# Altium schematic sheet Sheet4.SchDoc (part 1 of 3)
size A1; SheetNumber: 1; SheetTotal: 1
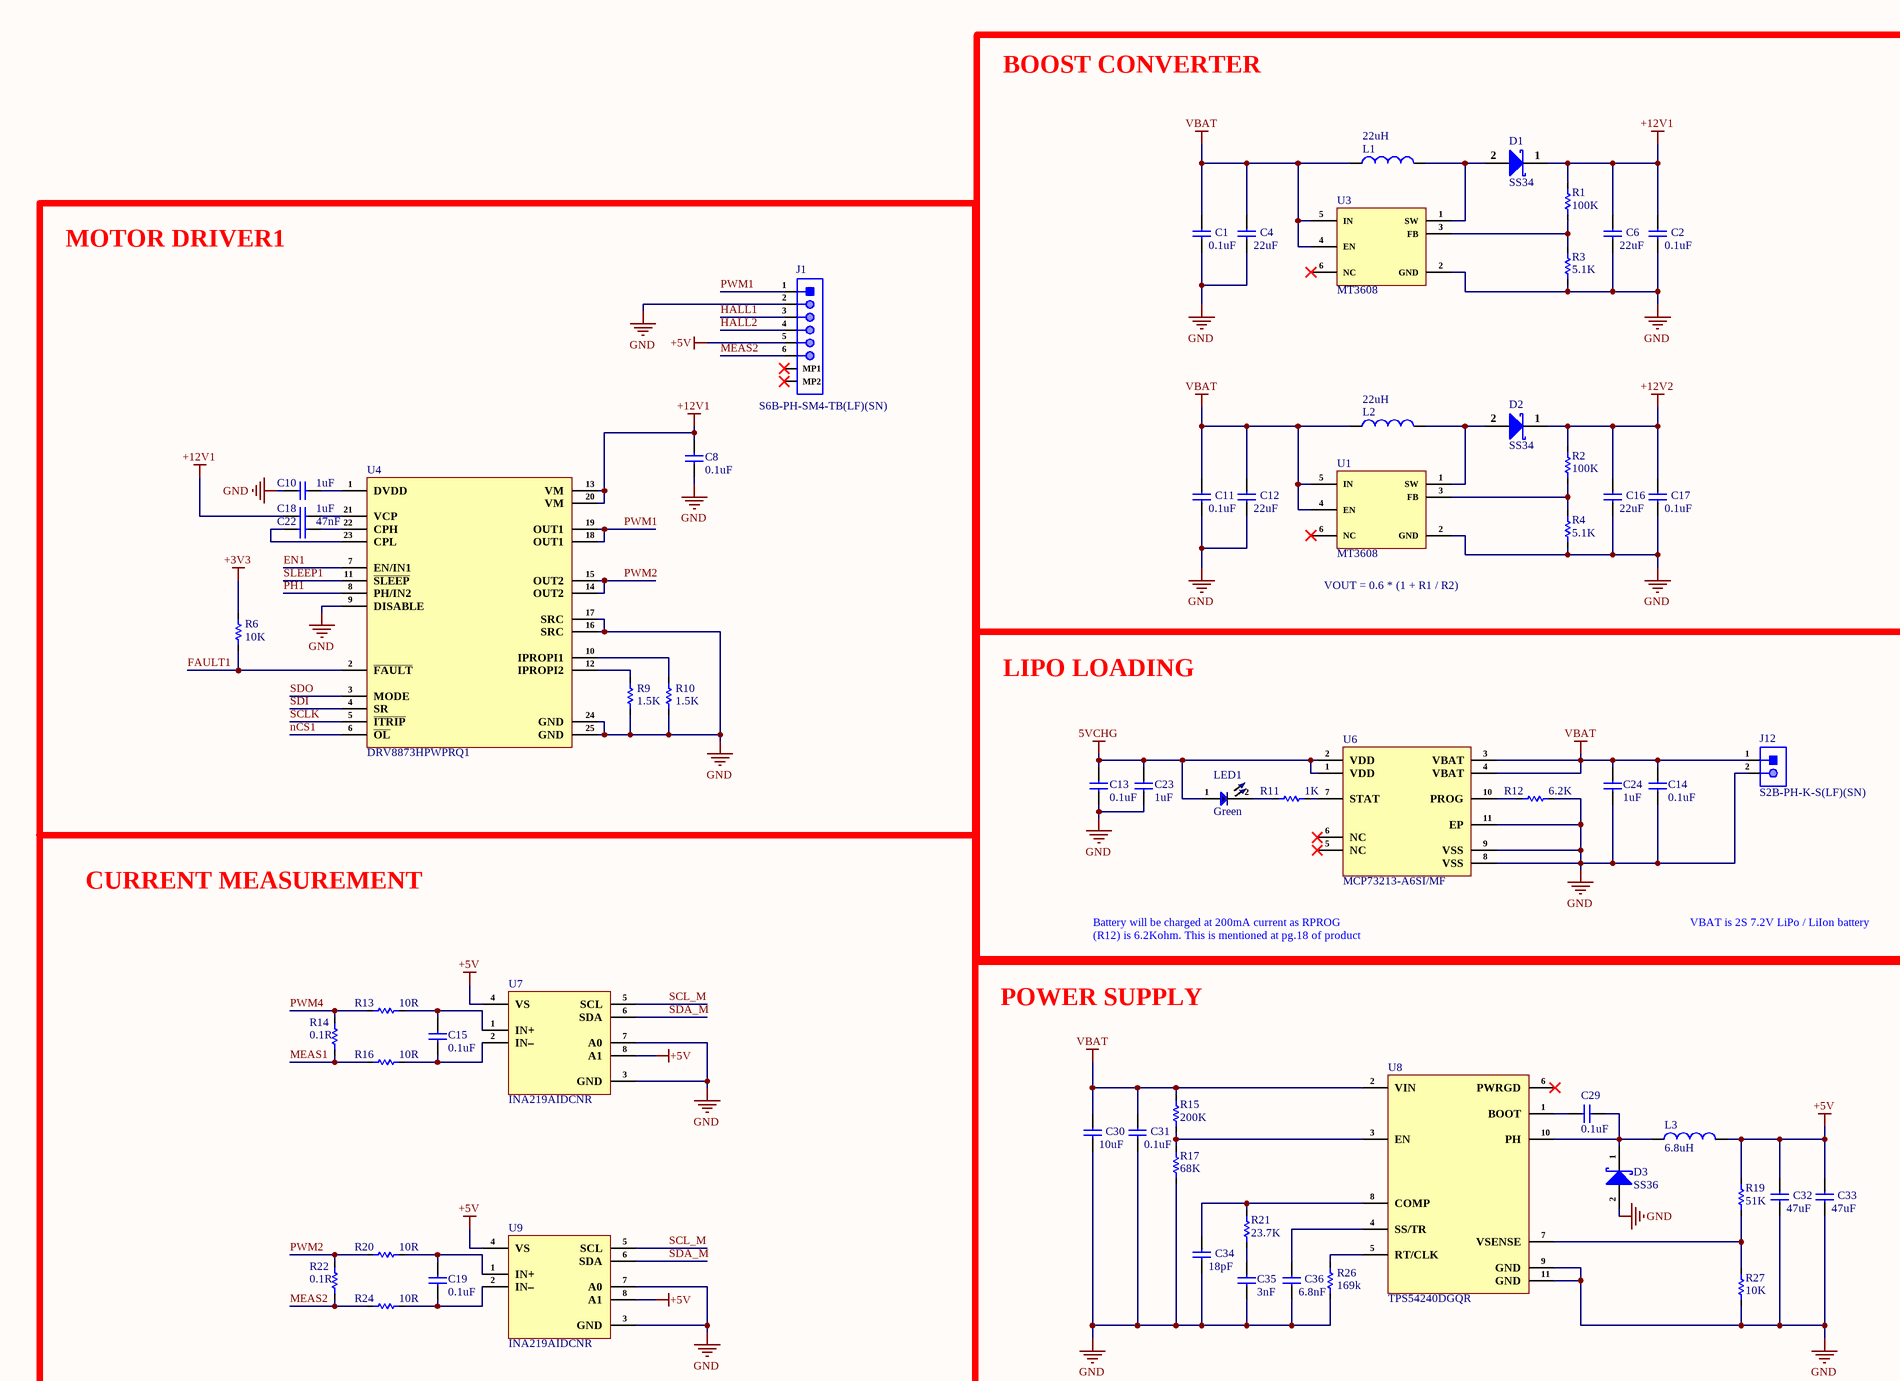
[diagram p0: Sheet4.SchDoc, top left]
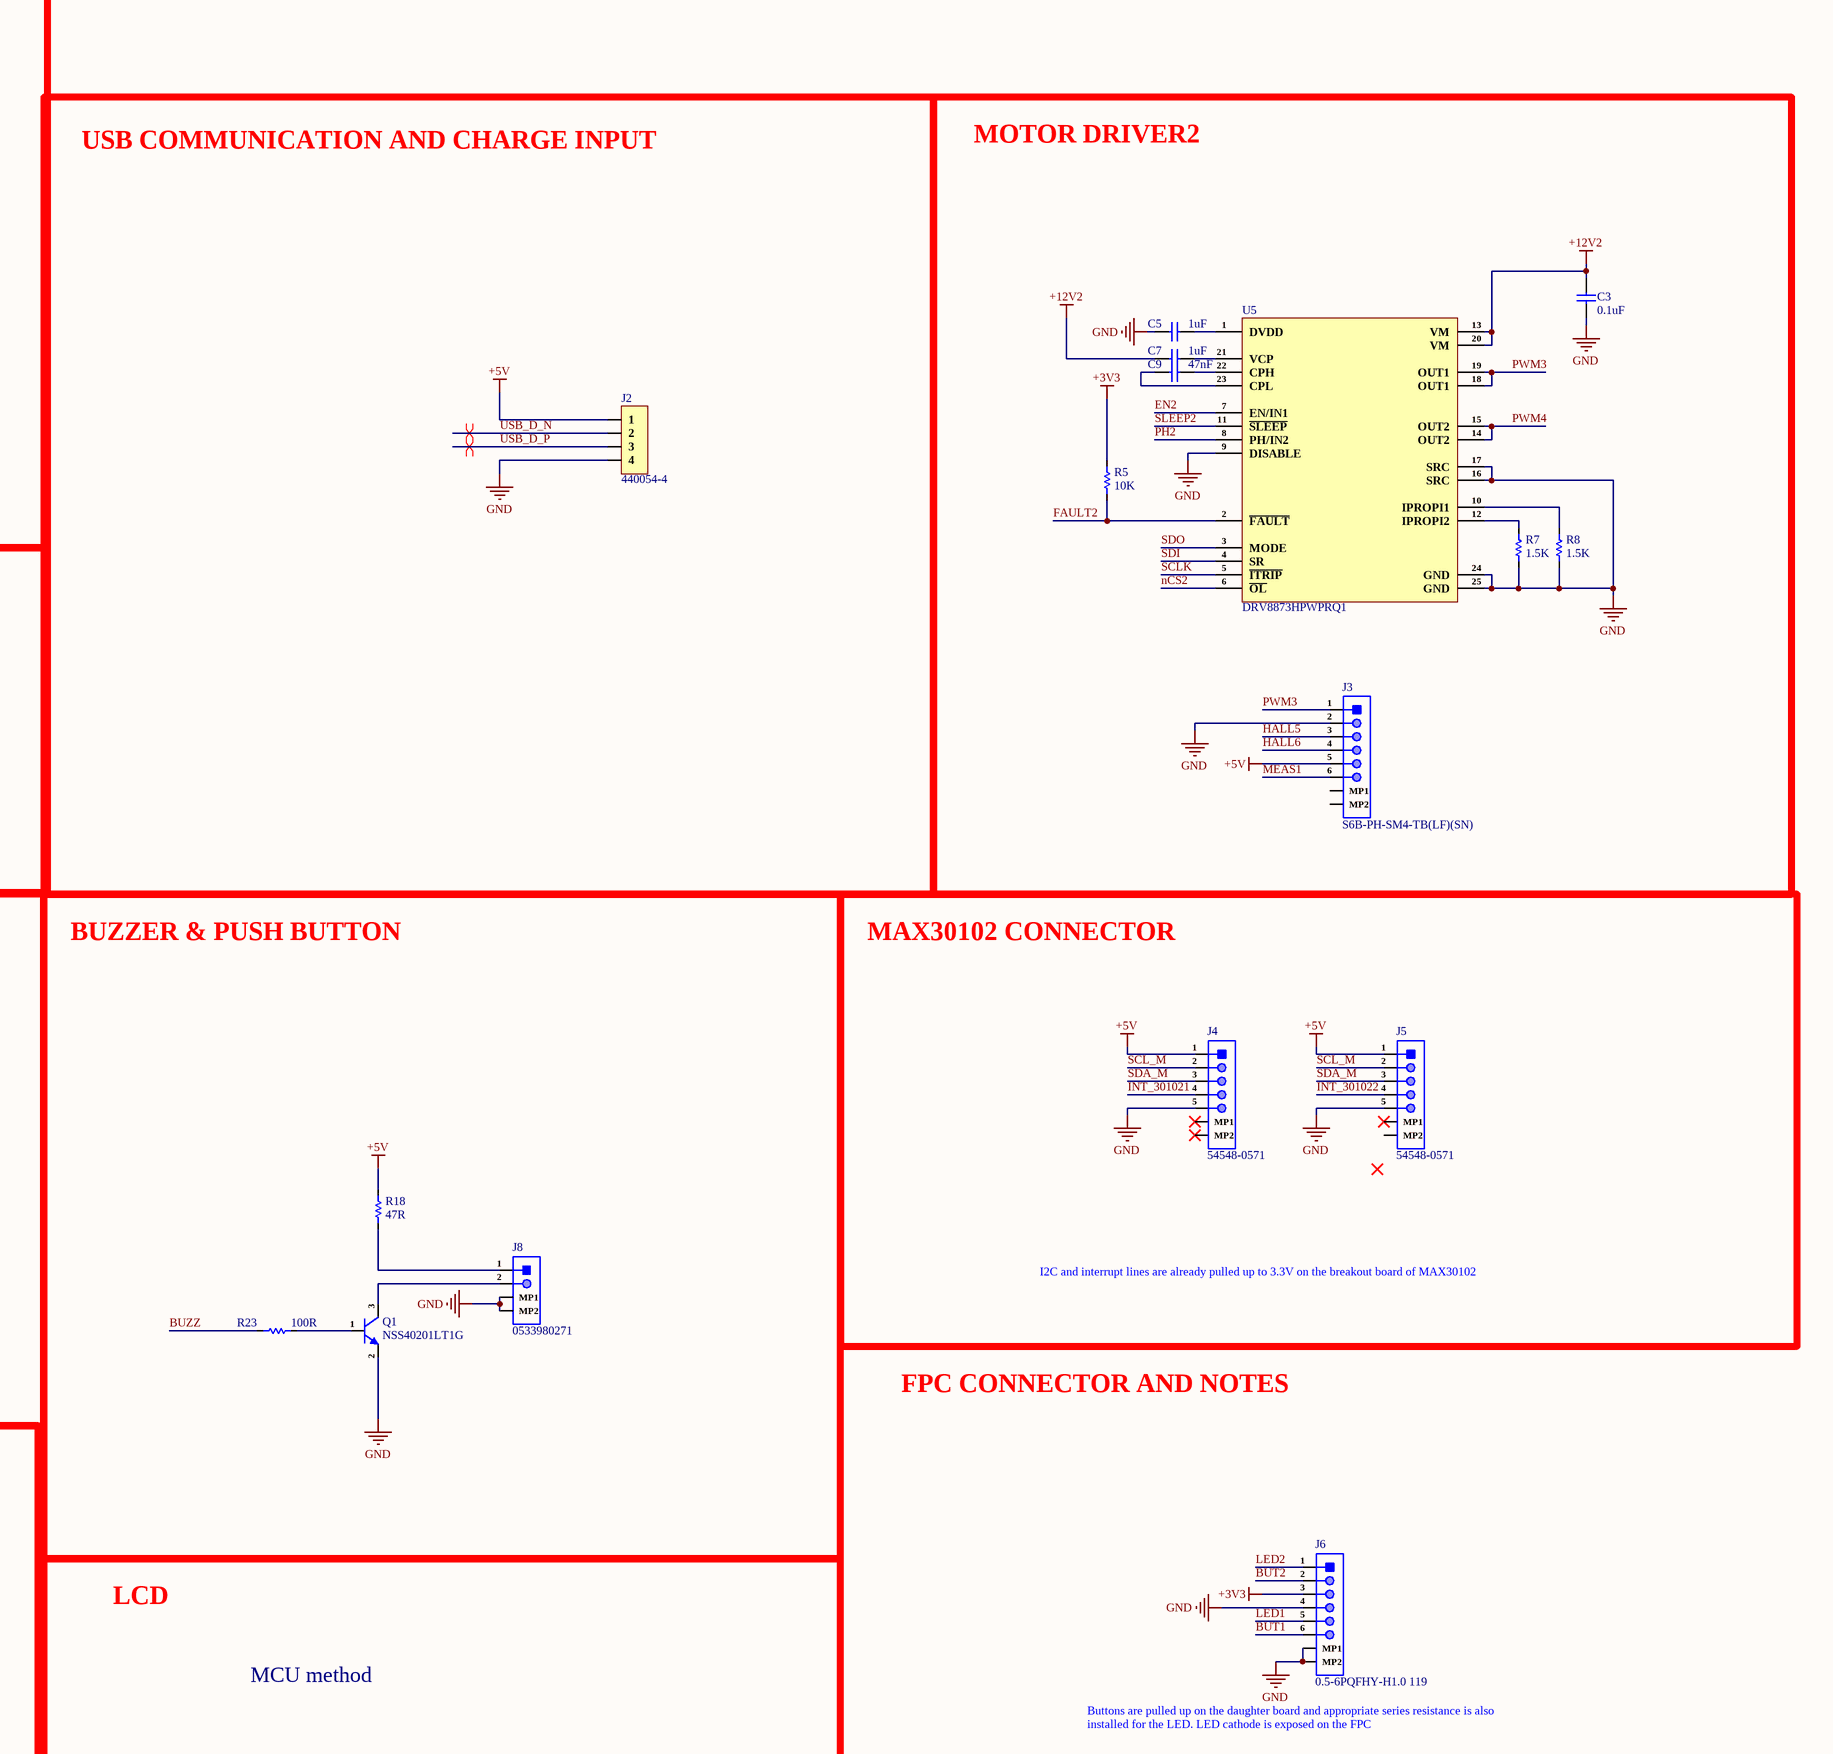
[diagram p1: Sheet4.SchDoc, top right]
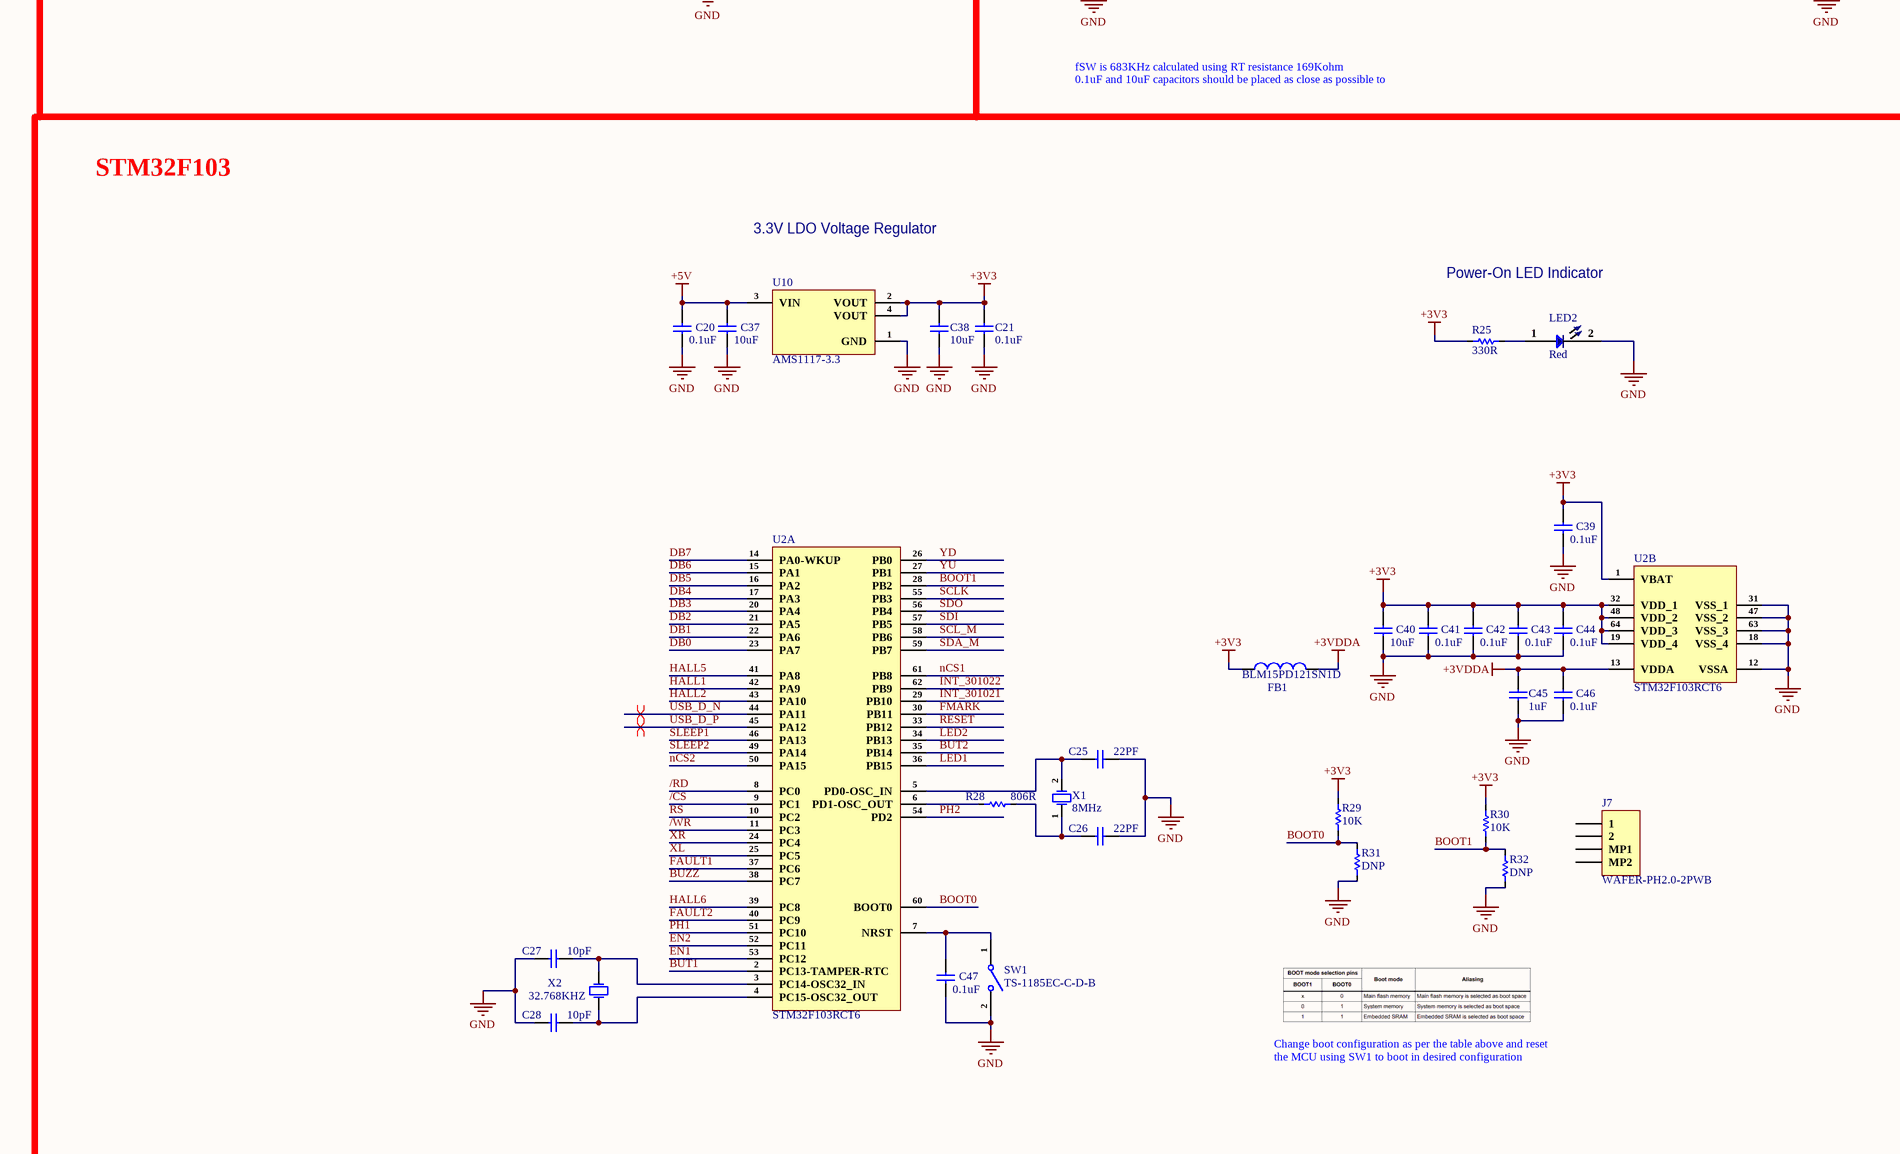
[diagram p2: Sheet4.SchDoc, bottom left]
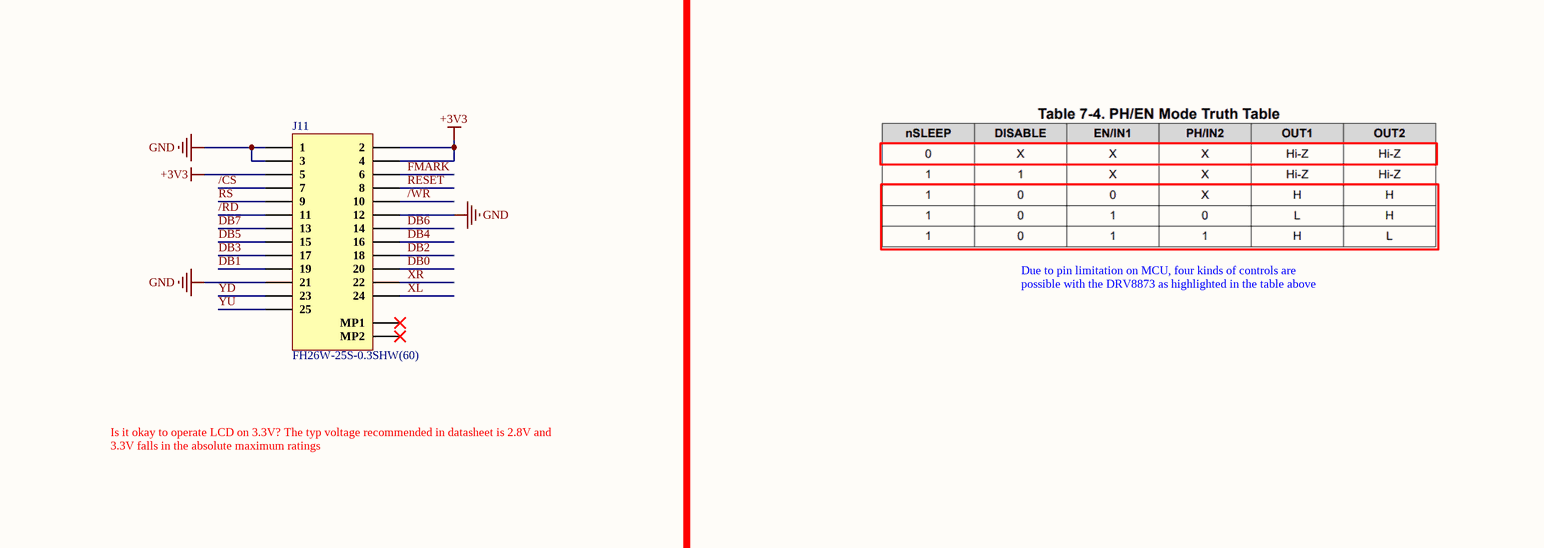
[diagram p3: Sheet4.SchDoc, bottom right]

## Parts
C1  0.1uF  [Cap-0402]
C2  0.1uF  [Cap-0402]
C3  0.1uF  [Cap-0402]
C4  22uF  [Cap-0805]
C5  1uF  [Cap-0402]
C6  22uF  [Cap-0805]
C7  1uF  [Cap-0402]
C8  0.1uF  [Cap-0402]
C9  47nF  [Cap-0402]
C10  1uF  [Cap-0402]
C11  0.1uF  [Cap-0402]
C12  22uF  [Cap-0805]
C13  0.1uF  [Cap-0402]
C14  0.1uF  [Cap-0402]
C15  0.1uF  [Cap-0402]
C16  22uF  [Cap-0805]
C17  0.1uF  [Cap-0402]
C18  1uF  [Cap-0402]
C19  0.1uF  [Cap-0402]
C20  0.1uF  [Cap-0402]
C21  0.1uF  [Cap-0402]
C22  47nF  [Cap-0402]
C23  1uF  [Cap-0402]
C24  1uF  [Cap-0402]
C25  22PF  [Cap-0402]
C26  22PF  [Cap-0402]
C27  10pF  [CAP-0201]
C28  10pF  [CAP-0201]
C29  0.1uF  [Cap-0402]
C30  10uF  [Cap-0603]
C31  0.1uF  [Cap-0402]
C32  47uF  [Cap-1206]
C33  47uF  [Cap-1206]
C34  18pF  [Cap-0603]
C35  3nF  [Cap-0402]
C36  6.8nF  [Cap-0603]
C37  10uF  [Cap-0603]
C38  10uF  [Cap-0603]
C39  0.1uF  [Cap-0402]
C40  10uF  [Cap-0603]
C41  0.1uF  [Cap-0402]
C42  0.1uF  [Cap-0402]
C43  0.1uF  [Cap-0402]
C44  0.1uF  [Cap-0402]
C45  1uF  [Cap-0402]
C46  0.1uF  [Cap-0402]
C47  0.1uF  [Cap-0402]
D1  SS34  [SMA]
D2  SS34  [SMA]
D3  SS36  [SMA]
FB1  BLM15PD121SN1D  [IND-0402]
J1  S6B-PH-SM4-TB(LF)(SN)  [S6B-PH-SM4-TB(LF)(SN)]
J2  440054-4  [440054-4]
J3  S6B-PH-SM4-TB(LF)(SN)  [S6B-PH-SM4-TB(LF)(SN)]
J4  54548-0571  [54548-0571]
J5  54548-0571  [54548-0571]
J6  0.5-6PQFHY-H1.0 119  [0.5-6PQFHY-H1.0 119]
J7  WAFER-PH2.0-2PWB  [WAFER-PH2.0-2PWB]
J8  0533980271  [0533980271]
J11  FH26W-25S-0.3SHW(60)  [FH26W-25S-0.3SHW(60)]
J12  S2B-PH-K-S(LF)(SN)  [S2B-PH-K-S(LF)(SN)]
L1  22uH  [SSL0804T-220M-N]
L2  22uH  [SSL0804T-220M-N]
L3  6.8uH  [0630CDMCCDS_6R8MC]
LED1  Green  [LED-0402]
LED2  Red  [LED-0402]
Q1  NSS40201LT1G  [SOT-23]
R1  100K  [Res-0603]
R2  100K  [Res-0603]
R3  5.1K  [Res-0603]
R4  5.1K  [Res-0603]
R5  10K  [Res-0402]
R6  10K  [Res-0402]
R7  1.5K  [Res-0603]
R8  1.5K  [Res-0603]
R9  1.5K  [Res-0603]
R10  1.5K  [Res-0603]
R11  1K  [Res-0402]
R12  6.2K  [Res-0603]
R13  10R  [RES-0805]
R14  0.1R  [Res-0603]
R15  200K  [Res-0603]
R16  10R  [RES-0805]
R17  68K  [Res-0603]
R18  47R  [Res-0402]
R19  51K  [Res-0402]
R20  10R  [RES-0805]
R21  23.7K  [Res-0201]
R22  0.1R  [Res-0603]
R23  100R  [Res-0603]
R24  10R  [RES-0805]
R25  330R  [Res-0603]
R26  169k  [Res-0603]
R27  10K  [Res-0402]
R28  806R  [Res-0402]
R29  10K  [Res-0402]
R30  10K  [Res-0402]
R31  DNP  [Res-0603]
R32  DNP  [Res-0603]
SW1  TS-1185EC-C-D-B  [TS-1185EC-C-D-B_]
U1  MT3608  [SOT-23-6]
U2  STM32F103RCT6  [64-LQFP (10x10)]  (parts A,B of 2)
U3  MT3608  [SOT-23-6]
U4  DRV8873HPWPRQ1  [HTSSOP-24-EP]
U5  DRV8873HPWPRQ1  [HTSSOP-24-EP]
U6  MCP73213-A6SI/MF  [TDFN-10-EP(3x3)]
U7  INA219AIDCNR  [SOT-23-8]
U8  TPS54240DGQR  [10-HVSSOP]
U9  INA219AIDCNR  [SOT-23-8]
U10  AMS1117-3.3  [SOT- 223]
X1  8MHz  [SMD5032-2P]
X2  32.768KHZ  [2-SMD, (2.00mm x 1.20mm)]

## Blocks framed on the sheet
BOOST CONVERTER: C1 C2 C4 C6 C11 C12 C16 C17 D1 D2 L1 L2 R1-R4 U1 U3
MOTOR DRIVER1: C8 C10 C18 C22 J1 R6 R9 R10 U4
USB COMMUNICATION AND CHARGE INPUT: J2
MOTOR DRIVER2: C3 C5 C7 C9 J3 R5 R7 R8 U5
LIPO LOADING: C13 C14 C23 C24 J12 LED1 R11 R12 U6
CURRENT MEASUREMENT: C15 C19 R13 R14 R16 R20 R22 R24 U7 U9
POWER SUPPLY: C29-C36 D3 L3 R15 R17 R19 R21 R26 R27 U8
BUZZER & PUSH BUTTON: J8 Q1 R18 R23
MAX30102 CONNECTOR: J4 J5
STM32F103: C20 C21 C25-C28 C37-C47 FB1 J7 LED2 R25 R28-R32 SW1 U2 U10 X1 X2
LCD: J11

## Nets
5VCHG: C13.2 C23.2 LED1.1 U6.1(VDD) U6.2(VDD)
+3V3: C21.2 C38.2 C39.2 C40.2 C41.2 C42.2 C43.2 C44.2 FB1.1 J6.3 J11.2 J11.4 J11.5 R5.2 R6.2 R25.1 R29.2 R30.2 U2.1(VBAT) U2.19(VDD_4) U2.32(VDD_1) U2.48(VDD_2) U2.64(VDD_3) U10.2(VOUT) U10.4(VOUT)
+3VDDA: C45.2 C46.2 FB1.2 U2.13(VDDA)
+5V: C20.2 C32.2 C33.2 C37.2 J1.5 J2.1 J3.5 J4.1 J5.1 L3.2 R18.2 R19.2 U7.4(VS) U7.8(A1) U9.4(VS) U9.8(A1) U10.3(VIN)
+12V1: C2.2 C6.2 C8.2 C18.2 D1.1(K) R1.2 U4.13(VM) U4.20(VM)
+12V2: C3.2 C7.2 C16.2 C17.2 D2.1(K) R2.2 U5.13(VM) U5.20(VM)
GND: C1.1 C2.1 C3.1 C4.1 C5.2 C6.1 C8.1 C10.2 C11.1 C12.1 C13.1 C14.1 C16.1 C17.1 C20.1 C21.1 C23.1 C24.1 C25.2 C26.2 C27.1 C28.1 C30.1 C31.1 C32.1 C33.1 C34.1 C35.1 C36.1 C37.1 C38.1 C39.1 C40.1 C41.1 C42.1 C43.1 C44.1 C45.1 C46.1 C47.1 D3.2(A) J1.2 J2.4 J3.2 J4.5 J5.5 J6.4 J6.MP1 J6.MP2 J8.MP1 J8.MP2 J11.1 J11.3 J11.12 J11.21 J12.2 LED2.2 Q1.2(E) R3.1 R4.1 R7.1 R8.1 R9.1 R10.1 R12.1 R17.1 R26.1 R27.1 R31.1 R32.1 SW1.2 U1.2(GND) U2.12(VSSA) U2.18(VSS_4) U2.31(VSS_1) U2.47(VSS_2) U2.63(VSS_3) U3.2(GND) U4.9(DISABLE) U4.16(SRC) U4.17(SRC) U4.24(GND) U4.25(GND) U5.9(DISABLE) U5.16(SRC) U5.17(SRC) U5.24(GND) U5.25(GND) U6.8(VSS) U6.9(VSS) U6.11(EP) U7.3(GND) U7.7(A0) U8.9(GND) U8.11(GND) U9.3(GND) U9.7(A0) U10.1(GND)
VBAT: C1.2 C4.2 C11.2 C12.2 C14.2 C24.2 C30.2 C31.2 J12.1 L1.1 L2.1 R15.2 U1.4(EN) U1.5(IN) U3.4(EN) U3.5(IN) U6.3(VBAT) U6.4(VBAT) U8.2(VIN)
/CS: J11.7 U2.9(PC1)
/RD: J11.11 U2.8(PC0)
/WR: J11.10 U2.11(PC3)
BOOT0: R29.1 R31.2 U2.60(BOOT0)
BOOT1: R30.1 R32.2 U2.28(PB2)
BUT1: J6.6 U2.2(PC13-TAMPER-RTC)
BUT2: J6.2 U2.35(PB14)
BUZZ: R23.1 U2.38(PC7)
DB0: J11.20 U2.23(PA7)
DB1: J11.19 U2.22(PA6)
DB2: J11.18 U2.21(PA5)
DB3: J11.17 U2.20(PA4)
DB4: J11.16 U2.17(PA3)
DB5: J11.15 U2.16(PA2)
DB6: J11.14 U2.15(PA1)
DB7: J11.13 U2.14(PA0-WKUP)
EN1: U2.53(PC12) U4.7(EN/IN1)
EN2: U2.52(PC11) U5.7(EN/IN1)
FAULT1: R6.1 U2.37(PC6) U4.2(~{FAULT})
FAULT2: R5.1 U2.40(PC9) U5.2(~{FAULT})
FMARK: J11.6 U2.30(PB11)
HALL1: J1.3 U2.42(PA9)
HALL2: J1.4 U2.43(PA10)
HALL5: J3.3 U2.41(PA8)
HALL6: J3.4 U2.39(PC8)
INT_301021: J4.4 U2.29(PB10)
INT_301022: J5.4 U2.62(PB9)
LED1: J6.5 U2.36(PB15)
LED2: J6.1 U2.34(PB13)
MEAS1: J3.6 R14.1 R16.1
MEAS2: J1.6 R22.1 R24.1
nCS1: U2.61(PB8) U4.6(~{OL})
nCS2: U2.50(PA15) U5.6(~{OL})
PH1: U2.51(PC10) U4.8(PH/IN2)
PH2: U2.54(PD2) U5.8(PH/IN2)
PWM1: J1.1 U4.18(OUT1) U4.19(OUT1)
PWM2: R20.1 R22.2 U4.14(OUT2) U4.15(OUT2)
PWM3: J3.1 U5.18(OUT1) U5.19(OUT1)
PWM4: R13.1 R14.2 U5.14(OUT2) U5.15(OUT2)
RESET: J11.8 U2.33(PB12)
RS: J11.9 U2.10(PC2)
SCL_M: J4.2 J5.2 U2.58(PB6) U7.5(SCL) U9.5(SCL)
SCLK: U2.55(PB3) U4.5(~{ITRIP}) U5.5(~{ITRIP})
SDA_M: J4.3 J5.3 U2.59(PB7) U7.6(SDA) U9.6(SDA)
SDI: U2.57(PB5) U4.4(SR) U5.4(SR)
SDO: U2.56(PB4) U4.3(MODE) U5.3(MODE)
SLEEP1: U2.46(PA13) U4.11(~{SLEEP})
SLEEP2: U2.49(PA14) U5.11(~{SLEEP})
USB_D_N: J2.2 U2.44(PA11)
USB_D_P: J2.3 U2.45(PA12)
XL: J11.24 U2.25(PC5)
XR: J11.22 U2.24(PC4)
YD: J11.23 U2.26(PB0)
YU: J11.25 U2.27(PB1)
NetC5_1: C5.1 U5.1(DVDD)
NetC7_1: C7.1 U5.21(VCP)
NetC9_1: C9.1 U5.23(CPL)
NetC9_2: C9.2 U5.22(CPH)
NetC10_1: C10.1 U4.1(DVDD)
NetC15_1: C15.1 R16.2 U7.2(IN–)
NetC15_2: C15.2 R13.2 U7.1(IN+)
NetC18_1: C18.1 U4.21(VCP)
NetC19_1: C19.1 R24.2 U9.2(IN–)
NetC19_2: C19.2 R20.2 U9.1(IN+)
NetC22_1: C22.1 U4.23(CPL)
NetC22_2: C22.2 U4.22(CPH)
NetC25_1: C25.1 U2.5(PD0-OSC_IN) X1.2(OSC2)
NetC26_1: C26.1 R28.2 X1.1(OSC1)
NetC27_2: C27.2 U2.3(PC14-OSC32_IN) X2.2(OSC2)
NetC28_2: C28.2 U2.4(PC15-OSC32_OUT) X2.1(OSC1)
NetC29_1: C29.1 D3.1(K) L3.1 U8.10(PH)
NetC29_2: C29.2 U8.1(BOOT)
NetC34_2: C34.2 R21.2 U8.8(COMP)
NetC35_2: C35.2 R21.1
NetC36_2: C36.2 U8.4(SS/TR)
NetC47_2: C47.2 SW1.1 U2.7(NRST)
NetD1_2: D1.2(A) L1.2 U3.1(SW)
NetD2_2: D2.2(A) L2.2 U1.1(SW)
NetJ8_1: J8.1 R18.1
NetJ8_2: J8.2 Q1.3(C)
NetLED1_2: LED1.2 R11.1
NetLED2_1: LED2.1 R25.2
NetQ1_1: Q1.1(B) R23.2
NetR1_1: R1.1 R3.2 U3.3(FB)
NetR2_1: R2.1 R4.2 U1.3(FB)
NetR7_2: R7.2 U5.12(IPROPI2)
NetR8_2: R8.2 U5.10(IPROPI1)
NetR9_2: R9.2 U4.12(IPROPI2)
NetR10_2: R10.2 U4.10(IPROPI1)
NetR11_2: R11.2 U6.7(STAT)
NetR12_2: R12.2 U6.10(PROG)
NetR15_1: R15.1 R17.2 U8.3(EN)
NetR19_1: R19.1 R27.2 U8.7(VSENSE)
NetR26_2: R26.2 U8.5(RT/CLK)
NetR28_1: R28.1 U2.6(PD1-OSC_OUT)

Not connected (* = marked no-connect by the designer): J1 MP1* MP2*; J3 MP1 MP2; J4 MP1* MP2*; J5 MP1* MP2; J7 1 2 MP1 MP2; J11 MP1* MP2*; U1 6(NC)*; U3 6(NC)*; U6 5(NC)* 6(NC)*; U8 6(PWRGD)*

## Layout directives
differential pair: USB_D_N, USB_D_P

## Notes on the sheet
- (near U1) VOUT = 0.6 * (1 + R1 / R2)
- Battery will be charged at 200mA current as RPROG (R12) is 6.2Kohm. This is mentioned at pg.18 of product datasheet
- VBAT is 2S 7.2V LiPo / LiIon battery
- I2C and interrupt lines are already pulled up to 3.3V on the breakout board of MAX30102
- fSW is 683KHz calculated using RT resistance 169Kohm
- 0.1uF and 10uF capacitors should be placed as close as possible to VIN
- FPC CONNECTOR AND NOTES
- 3.3V LDO Voltage Regulator
- Power-On LED Indicator
- MCU method
- (near J6) Buttons are pulled up on the daughter board and appropriate series resistance is also installed for the LED. LED cathode is exposed on the FPC
- Due to pin limitation on MCU, four kinds of controls are possible with the DRV8873 as highlighted in the table above
- Is it okay to operate LCD on 3.3V? The typ voltage recommended in datasheet is 2.8V and 3.3V falls in the absolute maximum ratings
- Change boot configuration as per the table above and reset the MCU using SW1 to boot in desired configuration